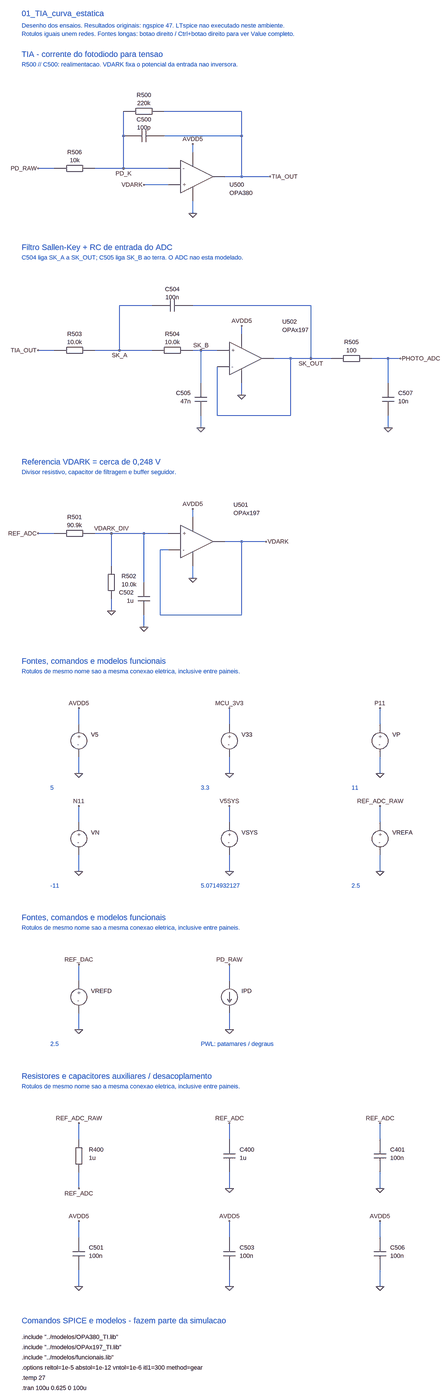
[diagram p0: schematic 01_TIA_curva_estatica.asc, whole sheet]
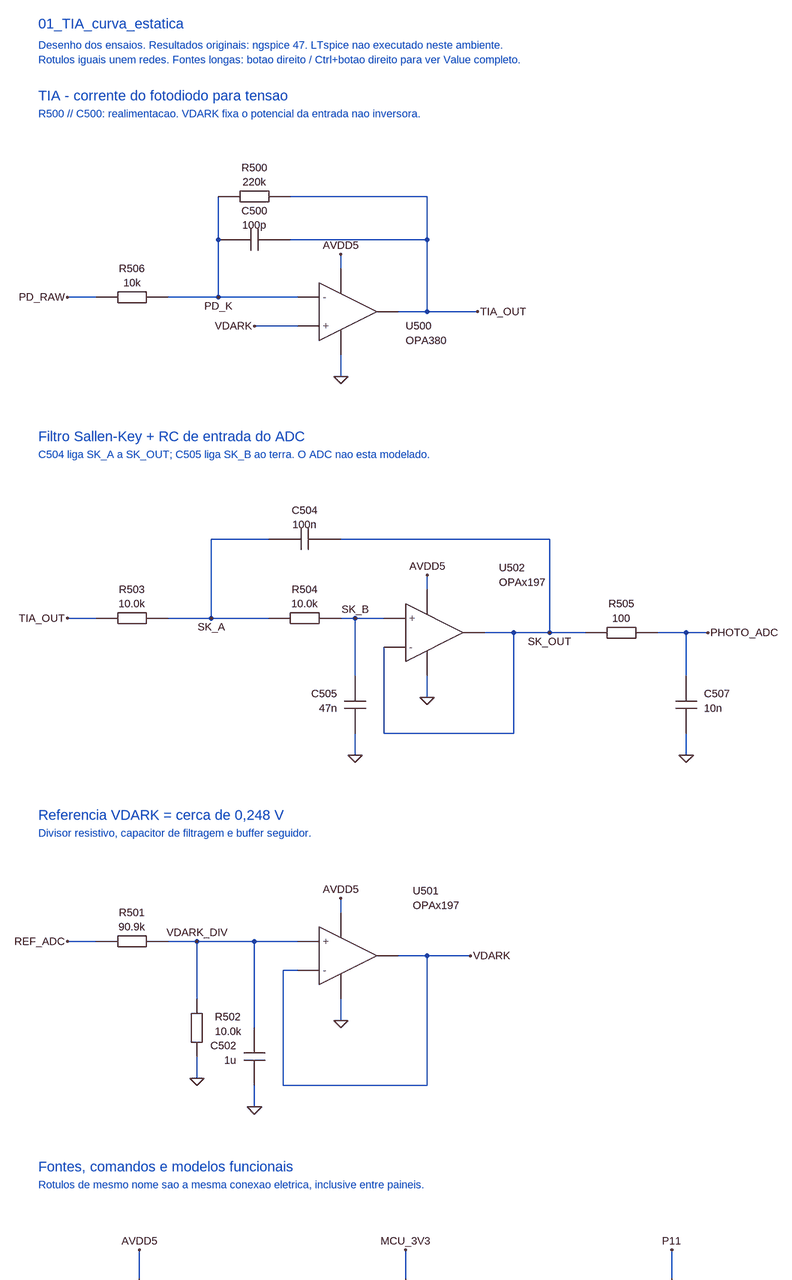
[diagram p1: schematic 01_TIA_curva_estatica.asc, part, row 1 of 2, column 1 of 1]
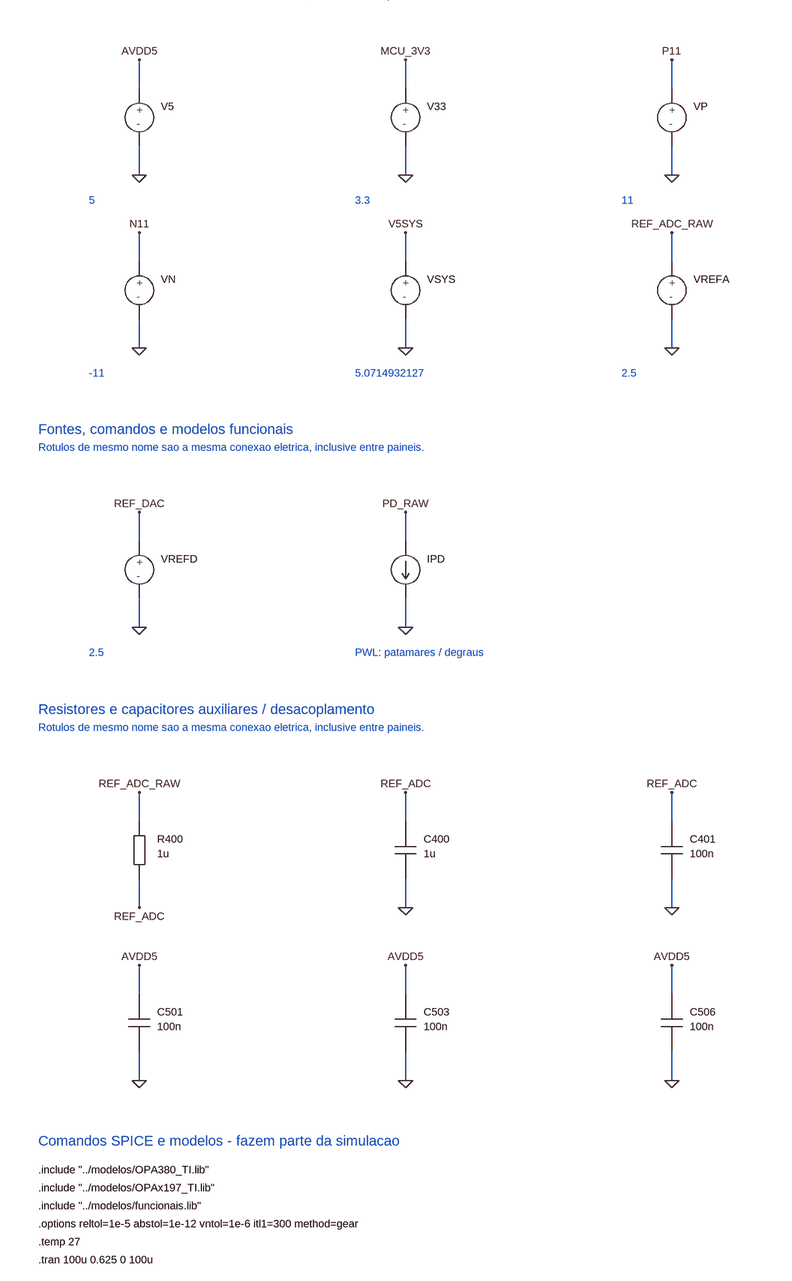
[diagram p2: schematic 01_TIA_curva_estatica.asc, part, row 2 of 2, column 1 of 1]
01_TIA_curva_estatica.asc, the LTspice schematic file:
Version 4.1
SHEET 1 1968 6512
TEXT 64 32 Left 3 ;01_TIA_curva_estatica
TEXT 64 80 Left 2 ;Desenho dos ensaios. Resultados originais: ngspice 47. LTspice nao executado neste ambiente.
TEXT 64 112 Left 2 ;Rotulos iguais unem redes. Fontes longas: botao direito / Ctrl+botao direito para ver Value completo.
TEXT 64 192 Left 3 ;TIA - corrente do fotodiodo para tensao
TEXT 64 232 Left 2 ;R500 // C500: realimentacao. VDARK fixa o potencial da entrada nao inversora.
WIRE 192 640 128 640
WIRE 352 640 640 640
WIRE 464 640 464 416
WIRE 624 416 928 416
WIRE 928 416 928 672
WIRE 928 672 864 672
WIRE 624 512 928 512
WIRE 736 576 736 544
WIRE 736 768 736 816
WIRE 640 704 544 704
WIRE 928 672 1040 672
FLAG 128 640 PD_RAW
FLAG 736 544 AVDD5
FLAG 736 816 0
FLAG 544 704 VDARK
FLAG 1040 672 TIA_OUT
FLAG 464 640 PD_K
SYMBOL CV_RH 192 640 R0
SYMATTR InstName R506
SYMATTR Value 10k
SYMBOL CV_RH 464 416 R0
SYMATTR InstName R500
SYMATTR Value 220k
SYMBOL CV_CH 464 512 R0
SYMATTR InstName C500
SYMATTR Value 100p
SYMBOL CV_OPD 704 608 R0
SYMATTR InstName U500
SYMATTR Value OPA380
TEXT 64 1136 Left 3 ;Filtro Sallen-Key + RC de entrada do ADC
TEXT 64 1176 Left 2 ;C504 liga SK_A a SK_OUT; C505 liga SK_B ao terra. O ADC nao esta modelado.
WIRE 192 1552 128 1552
WIRE 352 1552 576 1552
WIRE 448 1552 448 1376
WIRE 448 1376 576 1376
WIRE 736 1376 1200 1376
WIRE 1200 1376 1200 1584
WIRE 928 1488 928 1456
WIRE 928 1680 928 1728
WIRE 736 1552 832 1552
WIRE 768 1552 768 1680
WIRE 768 1808 768 1856
WIRE 832 1616 832 1808
WIRE 832 1808 1120 1808
WIRE 1120 1808 1120 1584
WIRE 1056 1584 1280 1584
WIRE 1440 1584 1552 1584
WIRE 1504 1584 1504 1680
WIRE 1504 1808 1504 1856
FLAG 128 1552 TIA_OUT
FLAG 928 1456 AVDD5
FLAG 928 1728 0
FLAG 768 1856 0
FLAG 1552 1584 PHOTO_ADC
FLAG 1504 1856 0
FLAG 448 1552 SK_A
FLAG 768 1552 SK_B
FLAG 1200 1584 SK_OUT
SYMBOL CV_RH 192 1552 R0
SYMATTR InstName R503
SYMATTR Value 10.0k
SYMBOL CV_RH 576 1552 R0
SYMATTR InstName R504
SYMATTR Value 10.0k
SYMBOL CV_CH 576 1376 R0
SYMATTR InstName C504
SYMATTR Value 100n
SYMBOL CV_OPF 896 1520 R0
SYMATTR InstName U502
SYMATTR Value OPAx197
SYMBOL CV_CVL 768 1680 R0
SYMATTR InstName C505
SYMATTR Value 47n
SYMBOL CV_RH 1280 1584 R0
SYMATTR InstName R505
SYMATTR Value 100
SYMBOL CV_CV 1504 1680 R0
SYMATTR InstName C507
SYMATTR Value 10n
TEXT 64 2080 Left 3 ;Referencia VDARK = cerca de 0,248 V
TEXT 64 2120 Left 2 ;Divisor resistivo, capacitor de filtragem e buffer seguidor.
WIRE 192 2432 128 2432
WIRE 352 2432 640 2432
WIRE 416 2432 416 2560
WIRE 416 2688 416 2736
WIRE 544 2432 544 2624
WIRE 544 2752 544 2800
WIRE 736 2368 736 2336
WIRE 736 2560 736 2608
WIRE 640 2496 608 2496
WIRE 608 2496 608 2752
WIRE 608 2752 928 2752
WIRE 928 2752 928 2464
WIRE 928 2464 864 2464
WIRE 928 2464 1024 2464
FLAG 128 2432 REF_ADC
FLAG 416 2736 0
FLAG 544 2800 0
FLAG 736 2336 AVDD5
FLAG 736 2608 0
FLAG 1024 2464 VDARK
FLAG 416 2432 VDARK_DIV
SYMBOL CV_RH 192 2432 R0
SYMATTR InstName R501
SYMATTR Value 90.9k
SYMBOL CV_RV 416 2560 R0
SYMATTR InstName R502
SYMATTR Value 10.0k
SYMBOL CV_CVL 544 2624 R0
SYMATTR InstName C502
SYMATTR Value 1u
SYMBOL CV_OPF 704 2400 R0
SYMATTR InstName U501
SYMATTR Value OPAx197
TEXT 64 3040 Left 3 ;Fontes, comandos e modelos funcionais
TEXT 64 3080 Left 2 ;Rotulos de mesmo nome sao a mesma conexao eletrica, inclusive entre paineis.
WIRE 288 3360 288 3296
WIRE 288 3488 288 3552
WIRE 880 3360 880 3296
WIRE 880 3488 880 3552
WIRE 1472 3360 1472 3296
WIRE 1472 3488 1472 3552
WIRE 288 3744 288 3680
WIRE 288 3872 288 3936
WIRE 880 3744 880 3680
WIRE 880 3872 880 3936
WIRE 1472 3744 1472 3680
WIRE 1472 3872 1472 3936
FLAG 288 3296 AVDD5
FLAG 288 3552 0
FLAG 880 3296 MCU_3V3
FLAG 880 3552 0
FLAG 1472 3296 P11
FLAG 1472 3552 0
FLAG 288 3680 N11
FLAG 288 3936 0
FLAG 880 3680 V5SYS
FLAG 880 3936 0
FLAG 1472 3680 REF_ADC_RAW
FLAG 1472 3936 0
SYMBOL CV_V 288 3360 R0
SYMATTR InstName V5
SYMATTR Value 5
SYMBOL CV_V 880 3360 R0
SYMATTR InstName V33
SYMATTR Value 3.3
SYMBOL CV_V 1472 3360 R0
SYMATTR InstName VP
SYMATTR Value 11
SYMBOL CV_V 288 3744 R0
SYMATTR InstName VN
SYMATTR Value -11
SYMBOL CV_V 880 3744 R0
SYMATTR InstName VSYS
SYMATTR Value 5.0714932127
SYMBOL CV_V 1472 3744 R0
SYMATTR InstName VREFA
SYMATTR Value 2.5
TEXT 176 3608 Left 2 ;5
TEXT 768 3608 Left 2 ;3.3
TEXT 1360 3608 Left 2 ;11
TEXT 176 3992 Left 2 ;-11
TEXT 768 3992 Left 2 ;5.0714932127
TEXT 1360 3992 Left 2 ;2.5
TEXT 64 4192 Left 3 ;Fontes, comandos e modelos funcionais
TEXT 64 4232 Left 2 ;Rotulos de mesmo nome sao a mesma conexao eletrica, inclusive entre paineis.
WIRE 288 4512 288 4448
WIRE 288 4640 288 4704
WIRE 880 4512 880 4448
WIRE 880 4640 880 4704
FLAG 288 4448 REF_DAC
FLAG 288 4704 0
FLAG 880 4448 PD_RAW
FLAG 880 4704 0
SYMBOL CV_V 288 4512 R0
SYMATTR InstName VREFD
SYMATTR Value 2.5
SYMBOL CV_I 880 4512 R0
SYMATTR InstName IPD
SYMATTR Value PWL(0 0 0.1 0 0.12499 0 0.125 1e-06 0.14999 1e-06 0.15 2e-06 0.17499 2e-06 0.175 3e-06 0.19999 3e-06 0.2 4e-06 0.22499 4e-06 0.225 5e-06 0.24999 5e-06 0.25 6e-06 0.27499 6e-06 0.275 7e-06 0.29999 7e-06 0.3 8e-06 0.32499 8e-06 0.325 9e-06 0.34999 9e-06 0.35 1e-05 0.37499 1e-05 0.375 1.1e-05 0.39999 1.1e-05 0.4 1.2e-05 0.42499 1.2e-05 0.425 1.3e-05 0.44999 1.3e-05 0.45 1.4e-05 0.47499 1.4e-05 0.475 1.5e-05 0.49999 1.5e-05 0.5 1.6e-05 0.52499 1.6e-05 0.525 1.7e-05 0.54999 1.7e-05 0.55 1.8e-05 0.57499 1.8e-05 0.575 1.9e-05 0.59999 1.9e-05 0.6 2e-05 0.62499 2e-05 0.625 2e-05)
TEXT 176 4760 Left 2 ;2.5
TEXT 768 4760 Left 2 ;PWL: patamares / degraus
TEXT 64 4960 Left 3 ;Resistores e capacitores auxiliares / desacoplamento
TEXT 64 5000 Left 2 ;Rotulos de mesmo nome sao a mesma conexao eletrica, inclusive entre paineis.
WIRE 288 5280 288 5216
WIRE 288 5408 288 5472
WIRE 880 5280 880 5216
WIRE 880 5408 880 5472
WIRE 1472 5280 1472 5216
WIRE 1472 5408 1472 5472
WIRE 288 5664 288 5600
WIRE 288 5792 288 5856
WIRE 880 5664 880 5600
WIRE 880 5792 880 5856
WIRE 1472 5664 1472 5600
WIRE 1472 5792 1472 5856
FLAG 288 5216 REF_ADC_RAW
FLAG 288 5472 REF_ADC
FLAG 880 5216 REF_ADC
FLAG 880 5472 0
FLAG 1472 5216 REF_ADC
FLAG 1472 5472 0
FLAG 288 5600 AVDD5
FLAG 288 5856 0
FLAG 880 5600 AVDD5
FLAG 880 5856 0
FLAG 1472 5600 AVDD5
FLAG 1472 5856 0
SYMBOL CV_RV 288 5280 R0
SYMATTR InstName R400
SYMATTR Value 1u
SYMBOL CV_CV 880 5280 R0
SYMATTR InstName C400
SYMATTR Value 1u
SYMBOL CV_CV 1472 5280 R0
SYMATTR InstName C401
SYMATTR Value 100n
SYMBOL CV_CV 288 5664 R0
SYMATTR InstName C501
SYMATTR Value 100n
SYMBOL CV_CV 880 5664 R0
SYMATTR InstName C503
SYMATTR Value 100n
SYMBOL CV_CV 1472 5664 R0
SYMATTR InstName C506
SYMATTR Value 100n
TEXT 64 6112 Left 3 ;Comandos SPICE e modelos - fazem parte da simulacao
TEXT 64 6176 Left 2 !.include "../modelos/OPA380_TI.lib"
TEXT 64 6216 Left 2 !.include "../modelos/OPAx197_TI.lib"
TEXT 64 6256 Left 2 !.include "../modelos/funcionais.lib"
TEXT 64 6296 Left 2 !.options reltol=1e-5 abstol=1e-12 vntol=1e-6 itl1=300 method=gear
TEXT 64 6336 Left 2 !.temp 27
TEXT 64 6376 Left 2 !.tran 100u 0.625 0 100u

The netlist it stands for:
* 01_TIA_curva_estatica.asc
R506 PD_RAW PD_K 10k
R500 PD_K TIA_OUT 220k
C500 PD_K TIA_OUT 100p
X§U500 VDARK PD_K AVDD5 0 TIA_OUT OPA380  ; pins + - V+ V- OUT
R503 TIA_OUT SK_A 10.0k
R504 SK_A SK_B 10.0k
C504 SK_A SK_OUT 100n
X§U502 SK_B SK_OUT AVDD5 0 SK_OUT OPAx197  ; pins + - V+ V- OUT
C505 SK_B 0 47n
R505 SK_OUT PHOTO_ADC 100
C507 PHOTO_ADC 0 10n
R501 REF_ADC VDARK_DIV 90.9k
R502 VDARK_DIV 0 10.0k
C502 VDARK_DIV 0 1u
X§U501 VDARK_DIV VDARK AVDD5 0 VDARK OPAx197  ; pins + - V+ V- OUT
V5 AVDD5 0 5
V33 MCU_3V3 0 3.3
VP P11 0 11
VN N11 0 -11
VSYS V5SYS 0 5.0714932127
VREFA REF_ADC_RAW 0 2.5
VREFD REF_DAC 0 2.5
IPD PD_RAW 0 PWL(0 0 0.1 0 0.12499 0 0.125 1e-06 0.14999 1e-06 0.15 2e-06 0.17499 2e-06 0.175 3e-06 0.19999 3e-06 0.2 4e-06 0.22499 4e-06 0.225 5e-06 0.24999 5e-06 0.25 6e-06 0.27499 6e-06 0.275 7e-06 0.29999 7e-06 0.3 8e-06 0.32499 8e-06 0.325 9e-06 0.34999 9e-06 0.35 1e-05 0.37499 1e-05 0.375 1.1e-05 0.39999 1.1e-05 0.4 1.2e-05 0.42499 1.2e-05 0.425 1.3e-05 0.44999 1.3e-05 0.45 1.4e-05 0.47499 1.4e-05 0.475 1.5e-05 0.49999 1.5e-05 0.5 1.6e-05 0.52499 1.6e-05 0.525 1.7e-05 0.54999 1.7e-05 0.55 1.8e-05 0.57499 1.8e-05 0.575 1.9e-05 0.59999 1.9e-05 0.6 2e-05 0.62499 2e-05 0.625 2e-05)
R400 REF_ADC_RAW REF_ADC 1u
C400 REF_ADC 0 1u
C401 REF_ADC 0 100n
C501 AVDD5 0 100n
C503 AVDD5 0 100n
C506 AVDD5 0 100n
* 01_TIA_curva_estatica
* Desenho dos ensaios. Resultados originais: ngspice 47. LTspice nao executado neste ambiente.
* Rotulos iguais unem redes. Fontes longas: botao direito / Ctrl+botao direito para ver Value completo.
* TIA - corrente do fotodiodo para tensao
* R500 // C500: realimentacao. VDARK fixa o potencial da entrada nao inversora.
* Filtro Sallen-Key + RC de entrada do ADC
* C504 liga SK_A a SK_OUT; C505 liga SK_B ao terra. O ADC nao esta modelado.
* Referencia VDARK = cerca de 0,248 V
* Divisor resistivo, capacitor de filtragem e buffer seguidor.
* Fontes, comandos e modelos funcionais
* Rotulos de mesmo nome sao a mesma conexao eletrica, inclusive entre paineis.
* 5
* 3.3
* 11
* -11
* 5.0714932127
* 2.5
* Fontes, comandos e modelos funcionais
* Rotulos de mesmo nome sao a mesma conexao eletrica, inclusive entre paineis.
* 2.5
* PWL: patamares / degraus
* Resistores e capacitores auxiliares / desacoplamento
* Rotulos de mesmo nome sao a mesma conexao eletrica, inclusive entre paineis.
* Comandos SPICE e modelos - fazem parte da simulacao
.include "../modelos/OPA380_TI.lib"
.include "../modelos/OPAx197_TI.lib"
.include "../modelos/funcionais.lib"
.options reltol=1e-5 abstol=1e-12 vntol=1e-6 itl1=300 method=gear
.temp 27
.tran 100u 0.625 0 100u
.backanno
.end